# Altium schematic sheet Power.SchDoc
size B; SheetNumber: 2; SheetTotal: 5; SPICEModelCacheRRGICJWA: <root> / <DocumentId>RRGICJWA</DocumentId> / </root>
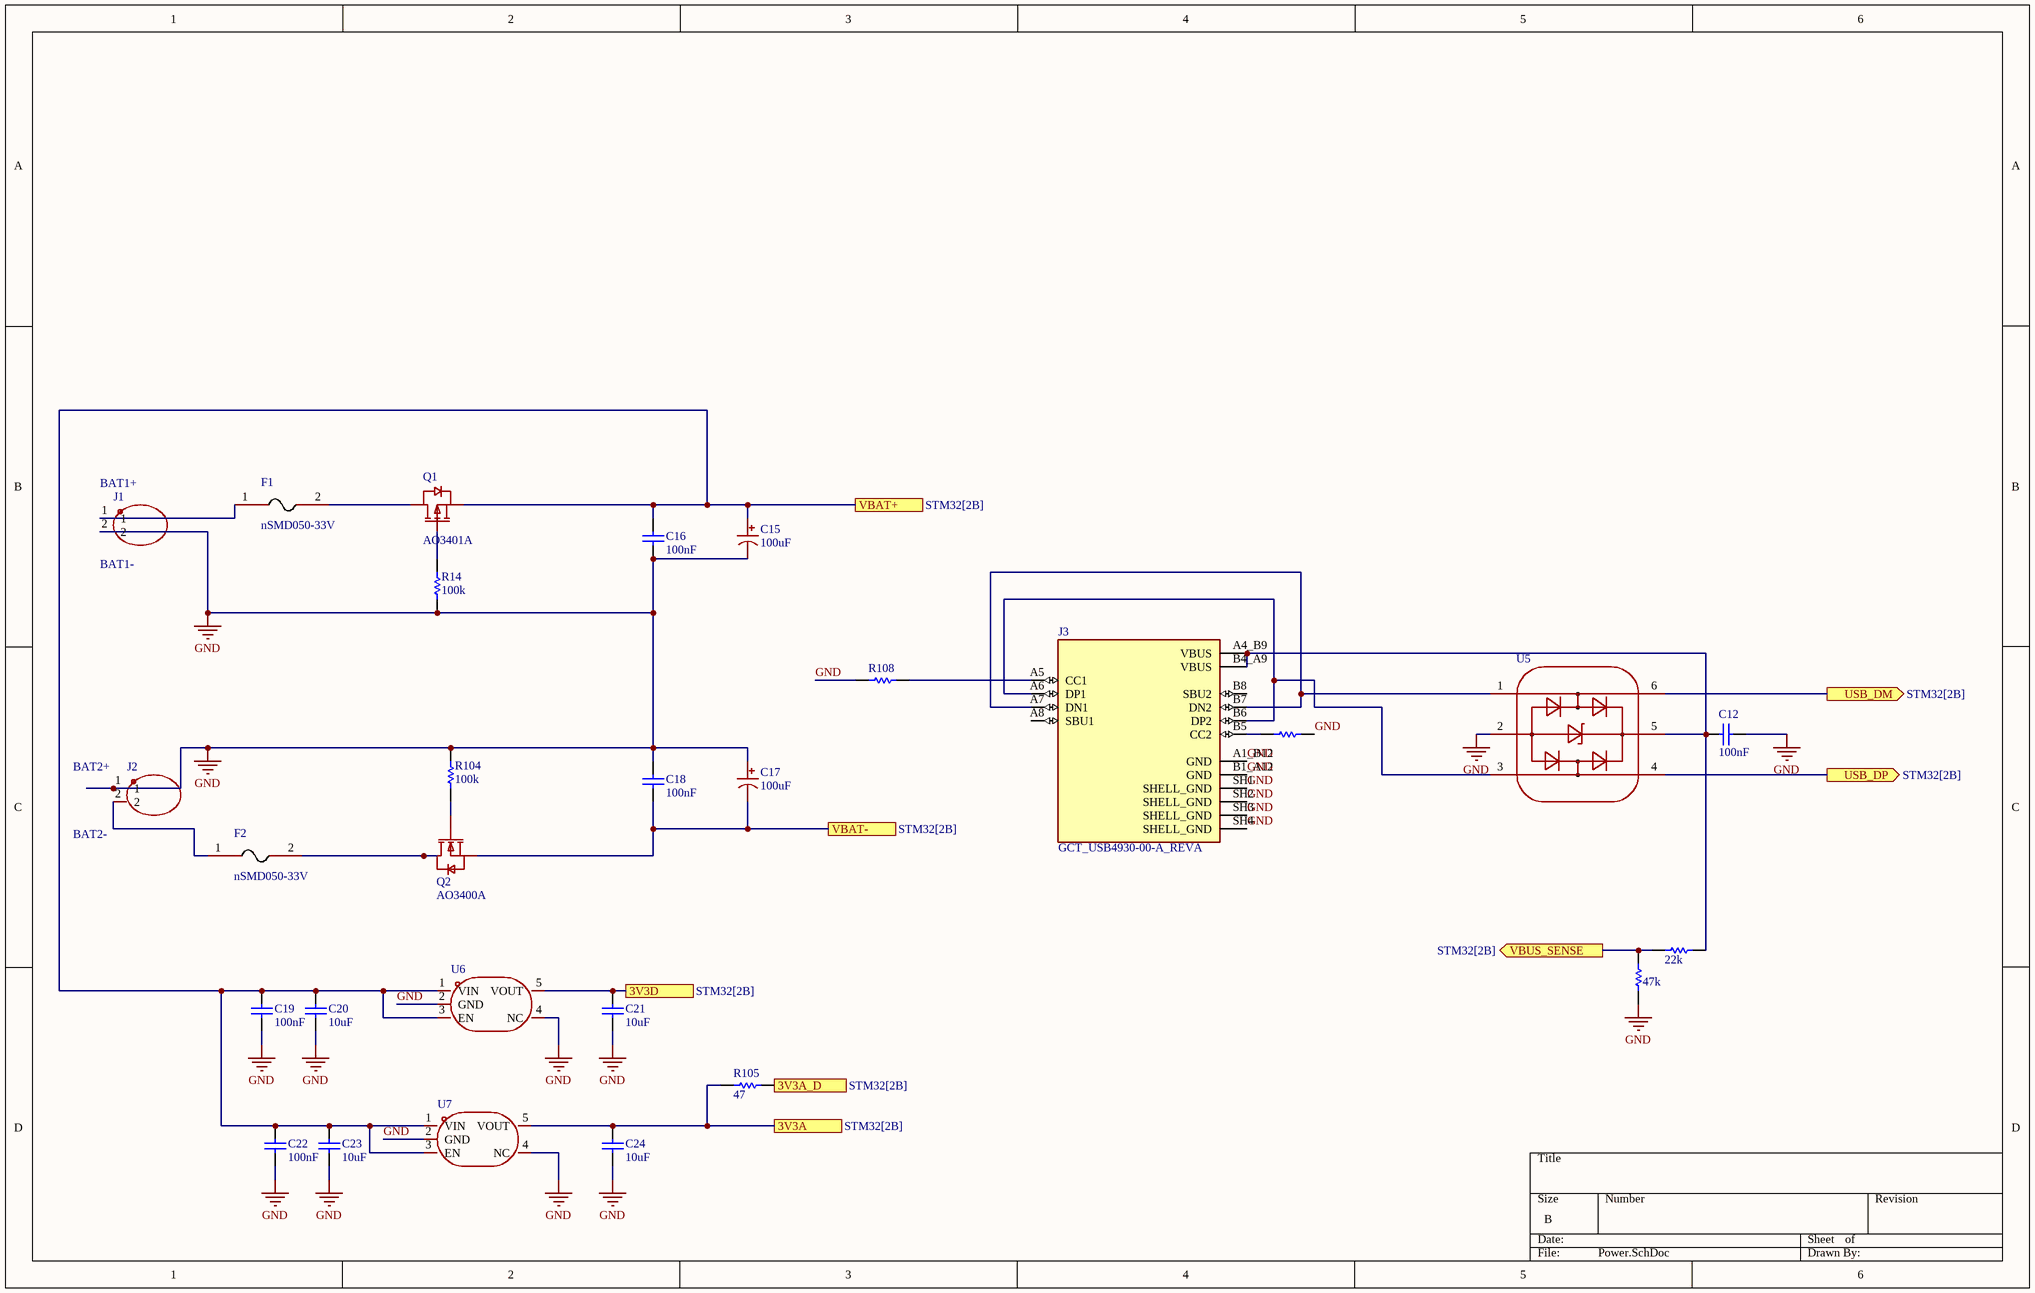
[diagram p0: Power.SchDoc]

## Parts
C12  value 100nF  [0603]  (hidden comment: Cap)
C15  100uF  [CAP-SMD_BD8.0-L8.3-W8.3-FD]
C16  value 100nF  [0805]  (hidden comment: Cap)
C17  100uF  [CAP-SMD_BD8.0-L8.3-W8.3-FD]
C18  value 100nF  [0805]  (hidden comment: Cap)
C19  value 100nF  [0805]  (hidden comment: Cap)
C20  value 10uF  [0805]  (hidden comment: Cap)
C21  value 10uF  [0805]  (hidden comment: Cap)
C22  value 100nF  [0805]  (hidden comment: Cap)
C23  value 10uF  [0805]  (hidden comment: Cap)
C24  value 10uF  [0805]  (hidden comment: Cap)
F1  nSMD050-33V  [1206]
F2  nSMD050-33V  [1206]
J1  B2B-XH-A(LF)(SN)  [B2B-XH-A(LF)(SN)]  (value not drawn)
J2  B2B-XH-A(LF)(SN)  [B2B-XH-A(LF)(SN)]  (value not drawn)
J3  GCT_USB4930-00-A_REVA  [GCT_USB4930-00-A_REVA]
Q1  AO3401A  [SOT-23-3_L2.9-W1.6-P1.90-LS2.8-BR]
Q2  AO3400A  [SOT-23-3_L2.9-W1.3-P1.90-LS2.4-BR]
R11  Res1  [0603]  (value not drawn)
R12  value 22k  [0603]  (hidden comment: Res1)
R13  value 47k  [0603]  (hidden comment: Res1)
R14  value 100k  [0805]  (hidden comment: Res1)
R104  value 100k  [0805]  (hidden comment: Res1)
R105  value 47  [0603]  (hidden comment: Res1)
R108  Res1  [0603]  (value not drawn)
U5  USBLC6-2SC6_C5261088  [SOT-23-6_L2.9-W1.6-P0.95-LS2.8-BR]  (value not drawn)
U6  AP2112K-3.3TRG1(MS)  [SOT-23-5_L2.9-W1.6-P0.95-LS2.7-BR]  (value not drawn)
U7  AP2112K-3.3TRG1(MS)  [SOT-23-5_L2.9-W1.6-P0.95-LS2.7-BR]  (value not drawn)

## Ports
3V3A (see STM32[2B]), 3V3A_D (see STM32[2B]), 3V3D (see STM32[2B]), USB_DM (out, see STM32[2B]), USB_DP (out, see STM32[2B]), VBAT+ (see STM32[2B]), VBAT- (see STM32[2B]), VBUS_SENSE (out, see STM32[2B])

## Nets
GND: C12.1 C15.2 C16.1 C17.1 C18.2 C19.1 C20.1 C21.1 C22.1 C23.1 C24.1 J1.2 J2.1 J3.A1_B12(GND) J3.B1_A12(GND) J3.SH1(SHELL_GND) J3.SH2(SHELL_GND) J3.SH3(SHELL_GND) J3.SH4(SHELL_GND) R11.2 R13.1 R14.2 R104.1 R108.2 U5.2 U6.2(GND) U6.4(NC) U7.2(GND) U7.4(NC)
3V3A: C24.2 R105.1 U7.5(VOUT) ; port 3V3A
3V3A_D: R105.2 ; port 3V3A_D
3V3D: C21.2 U6.5(VOUT) ; port 3V3D
USB_DM: U5.6 ; port USB_DM
USB_DP: U5.4 ; port USB_DP
VBAT+: C15.1 C16.2 C19.2 C20.2 C22.2 C23.2 Q1.2(S) U6.1(VIN) U6.3(EN) U7.1(VIN) U7.3(EN) ; port VBAT+
VBAT-: C17.2 C18.1 Q2.2(S) ; port VBAT-
VBUS_SENSE: R12.2 R13.2 ; port VBUS_SENSE
NetC12_2: C12.2 J3.A4_B9(VBUS) J3.B4_A9(VBUS) R12.1 U5.5
NetF1_1: F1.1 J1.1
NetF1_2: F1.2 Q1.3(D)
NetF2_1: F2.1 J2.2
NetF2_2: F2.2 Q2.3(D)
NetJ3_A5: J3.A5(CC1) R108.1
NetJ3_A6: J3.A6(DP1) J3.B6(DP2) U5.3
NetJ3_A7: J3.A7(DN1) J3.B7(DN2) U5.1
NetJ3_B5: J3.B5(CC2) R11.1
NetQ1_1: Q1.1(G) R14.1
NetQ2_1: Q2.1(G) R104.2

Not connected (* = marked no-connect by the designer): J3 A8(SBU1) B8(SBU2)

## Notes on the sheet
- (near J1) BAT1+
- (near J1) BAT1-
- (near J2) BAT2+
- (near J2) BAT2-

## Library data of the parts
C12 C16 C18-C24 = Cap: Capacitor; Published: 8-Jun-2000; LatestRevisionDate: 17-Jul-2002; LatestRevisionNote: Re-released for DXP Platform.; PackageReference: RAD-0.3; Publisher: Altium Limited; PackageDescription: Radial Cap, Thru-Hole; 2 Leads; 0.3 in Pin Spacing
C15 C17 = VT1H101M0810: 100 µF, 50 V aluminum electrolytic capacitor, ±20%, SMD, 8 × 10.2 mm, 105°C
F1 F2 = nSMD050-33V: Resettable PTC fuse, 0.5 A hold current, 33 V max
J1 J2 = B2B-XH-A(LF)(SN): 2-pin JST XH series wire-to-board header, 2.5 mm pitch, straight through-hole, 3 A, 250 V
J3 = GCT_USB4930-00-A_REVA: Type C USB 2.0 Connector
Q1 = AO3401A_C5379091: P-channel MOSFET, −30 V, −4 A, low RDS(on)
Q2 = AO3400A_C42419946: N-channel MOSFET, 30 V, 5.7 A, low RDS(on)
R11 R108 = Res1: Resistor; Value: 5.1K; Published: 8-Jun-2000; LatestRevisionDate: 17-Jul-2002; LatestRevisionNote: Re-released for DXP Platform.; PackageReference: AXIAL-0.3; Publisher: Altium Limited; PackageDescription: Axial Device, Thru-Hole; 2 Leads; 0.3 in Pin Spacing
R12-R14 R104 R105 = Res1: Resistor; Published: 8-Jun-2000; LatestRevisionDate: 17-Jul-2002; LatestRevisionNote: Re-released for DXP Platform.; PackageReference: AXIAL-0.3; Publisher: Altium Limited; PackageDescription: Axial Device, Thru-Hole; 2 Leads; 0.3 in Pin Spacing
U6 U7 = AP2112K-3.3TRG1(MS): 3.3 V, 600 mA fixed-output LDO regulator with enable